# EasyEDA Pro project stm32rct6开发板.epro, schematic Schematic1

## Sheets
1 主控: Assembly Variant: Basic; Board Name: Board1; Create Date: 2026-08-18; Page Name: P1; Project Name: New Project_2026-08-18_10-06-32; Schematic Name: Schematic1; Update Date: 2026-08-18; Company: 嘉立创EDA; Page Size: A4; Version: V1.0
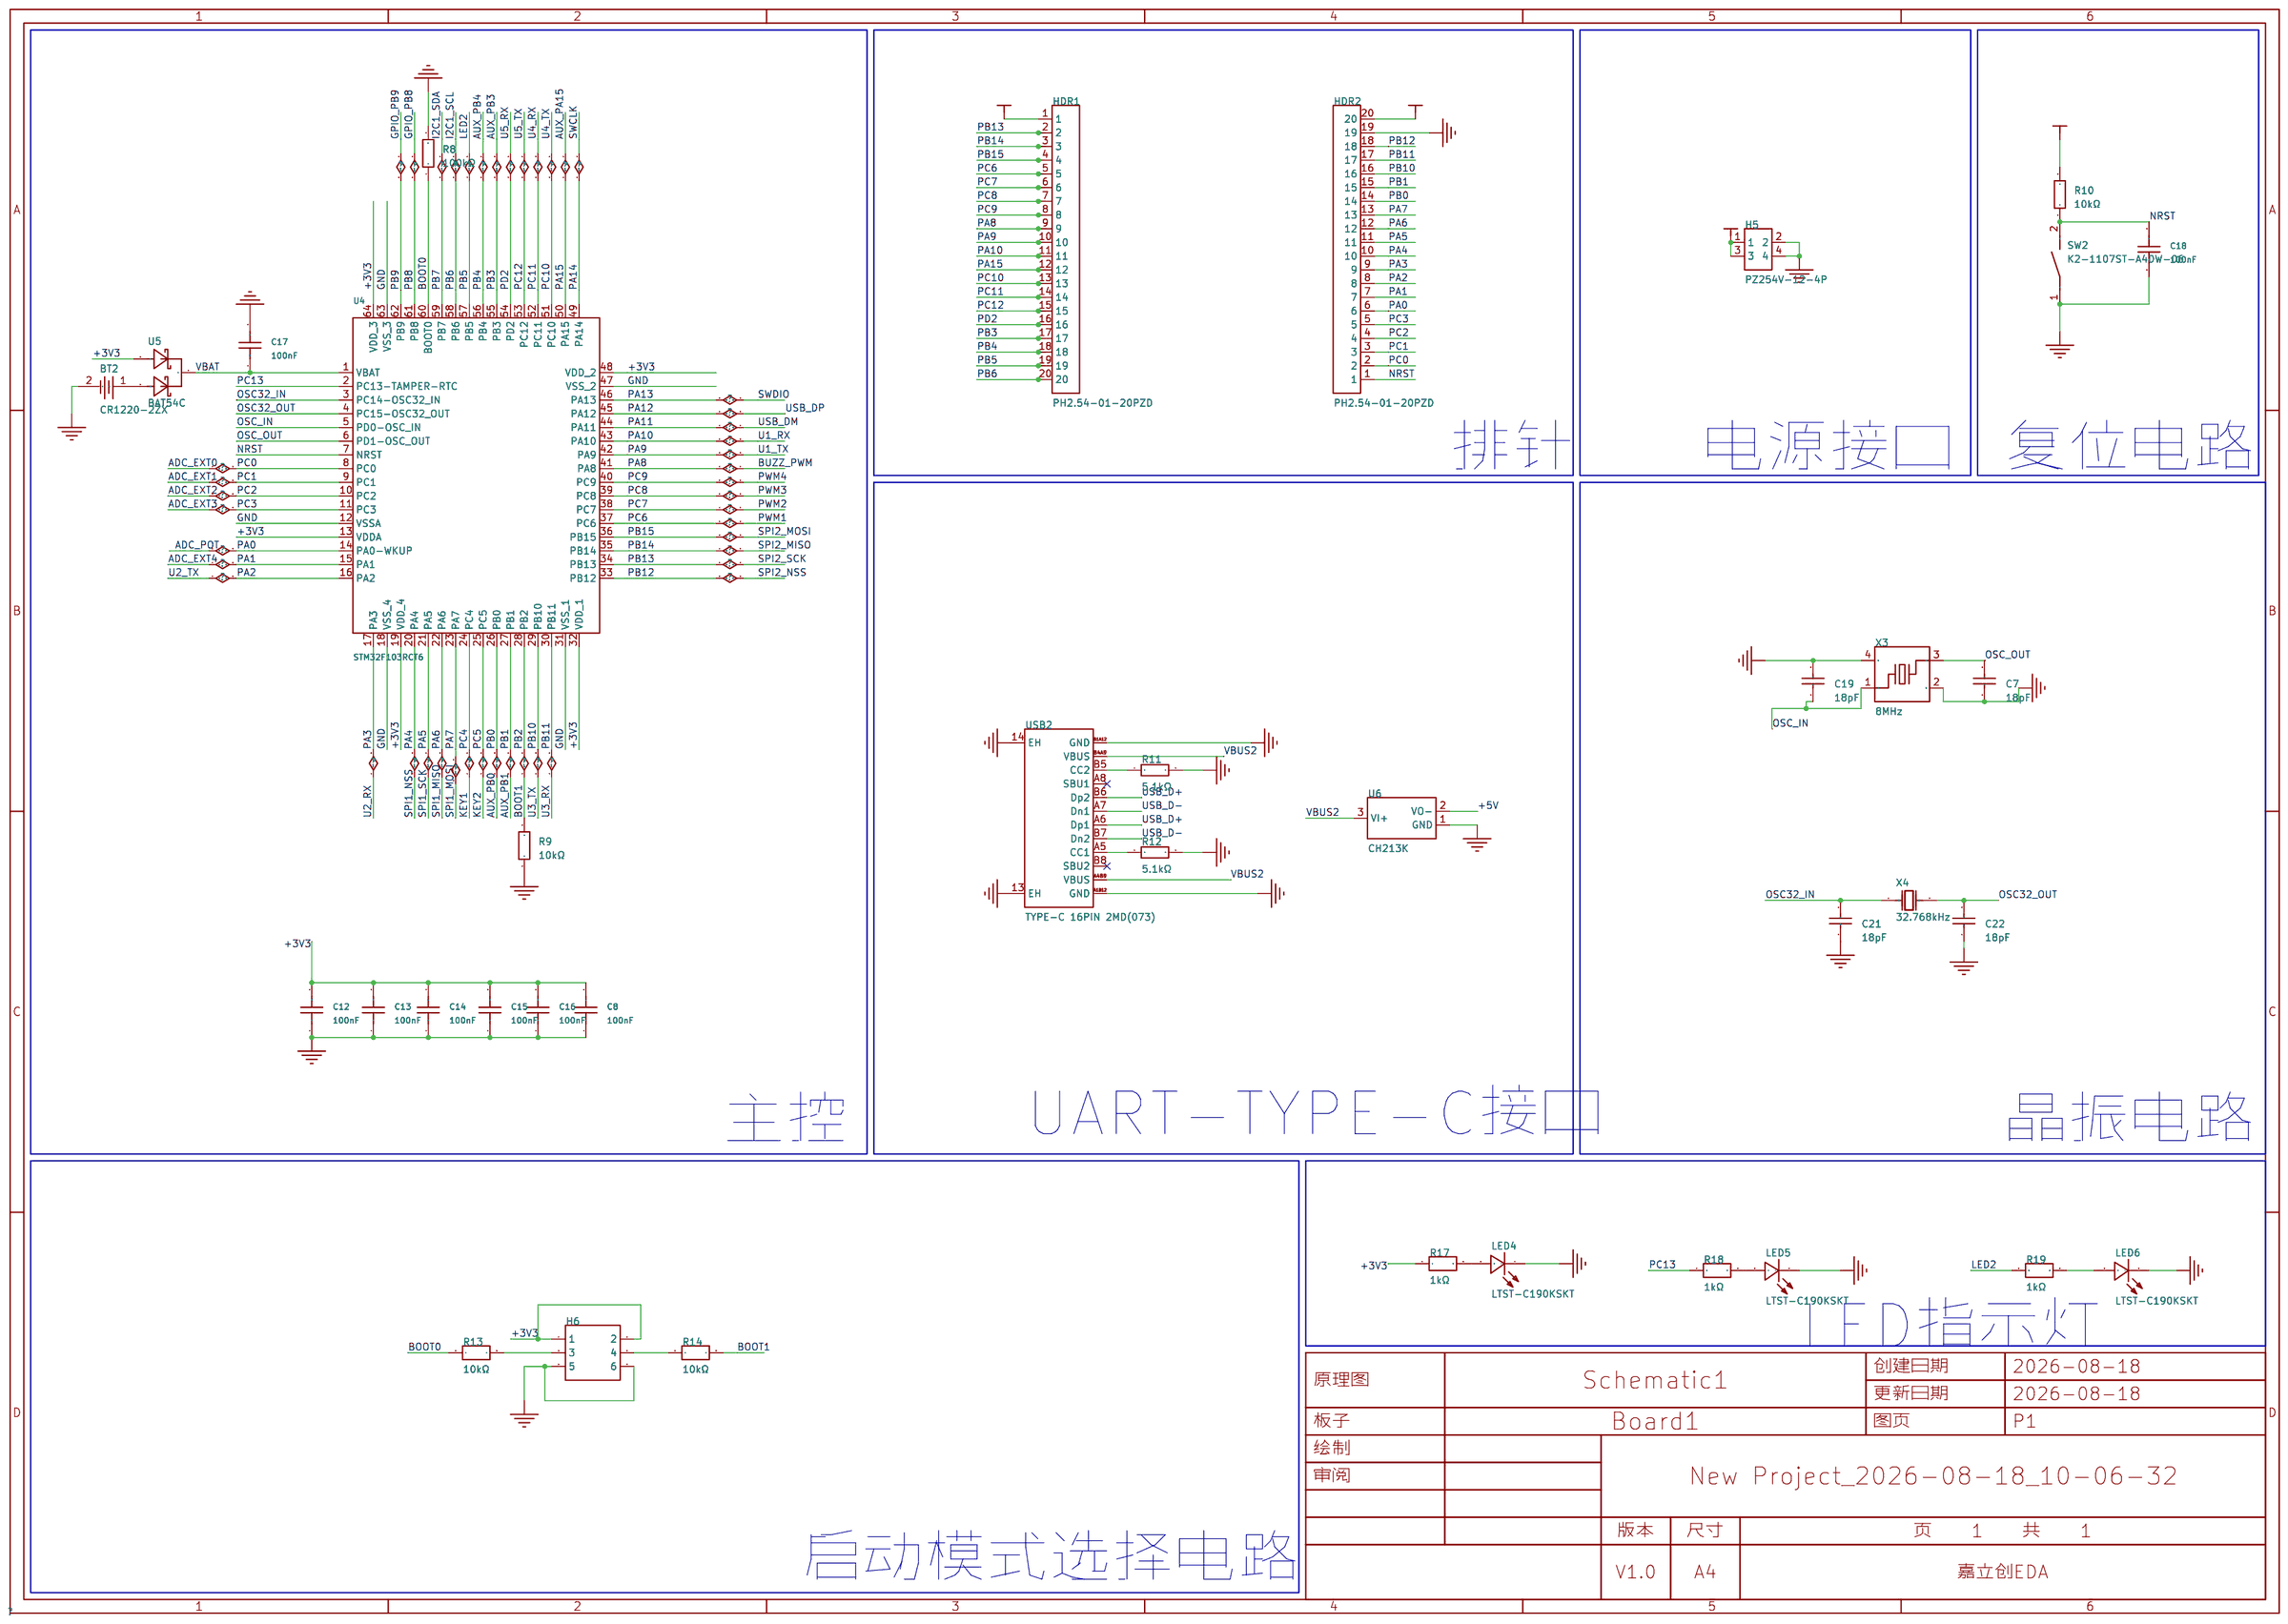
[diagram p0: 主控]
2 电源: Create Date: 2026-09-19; Project Name: 教学; Update Date: 2026-09-19
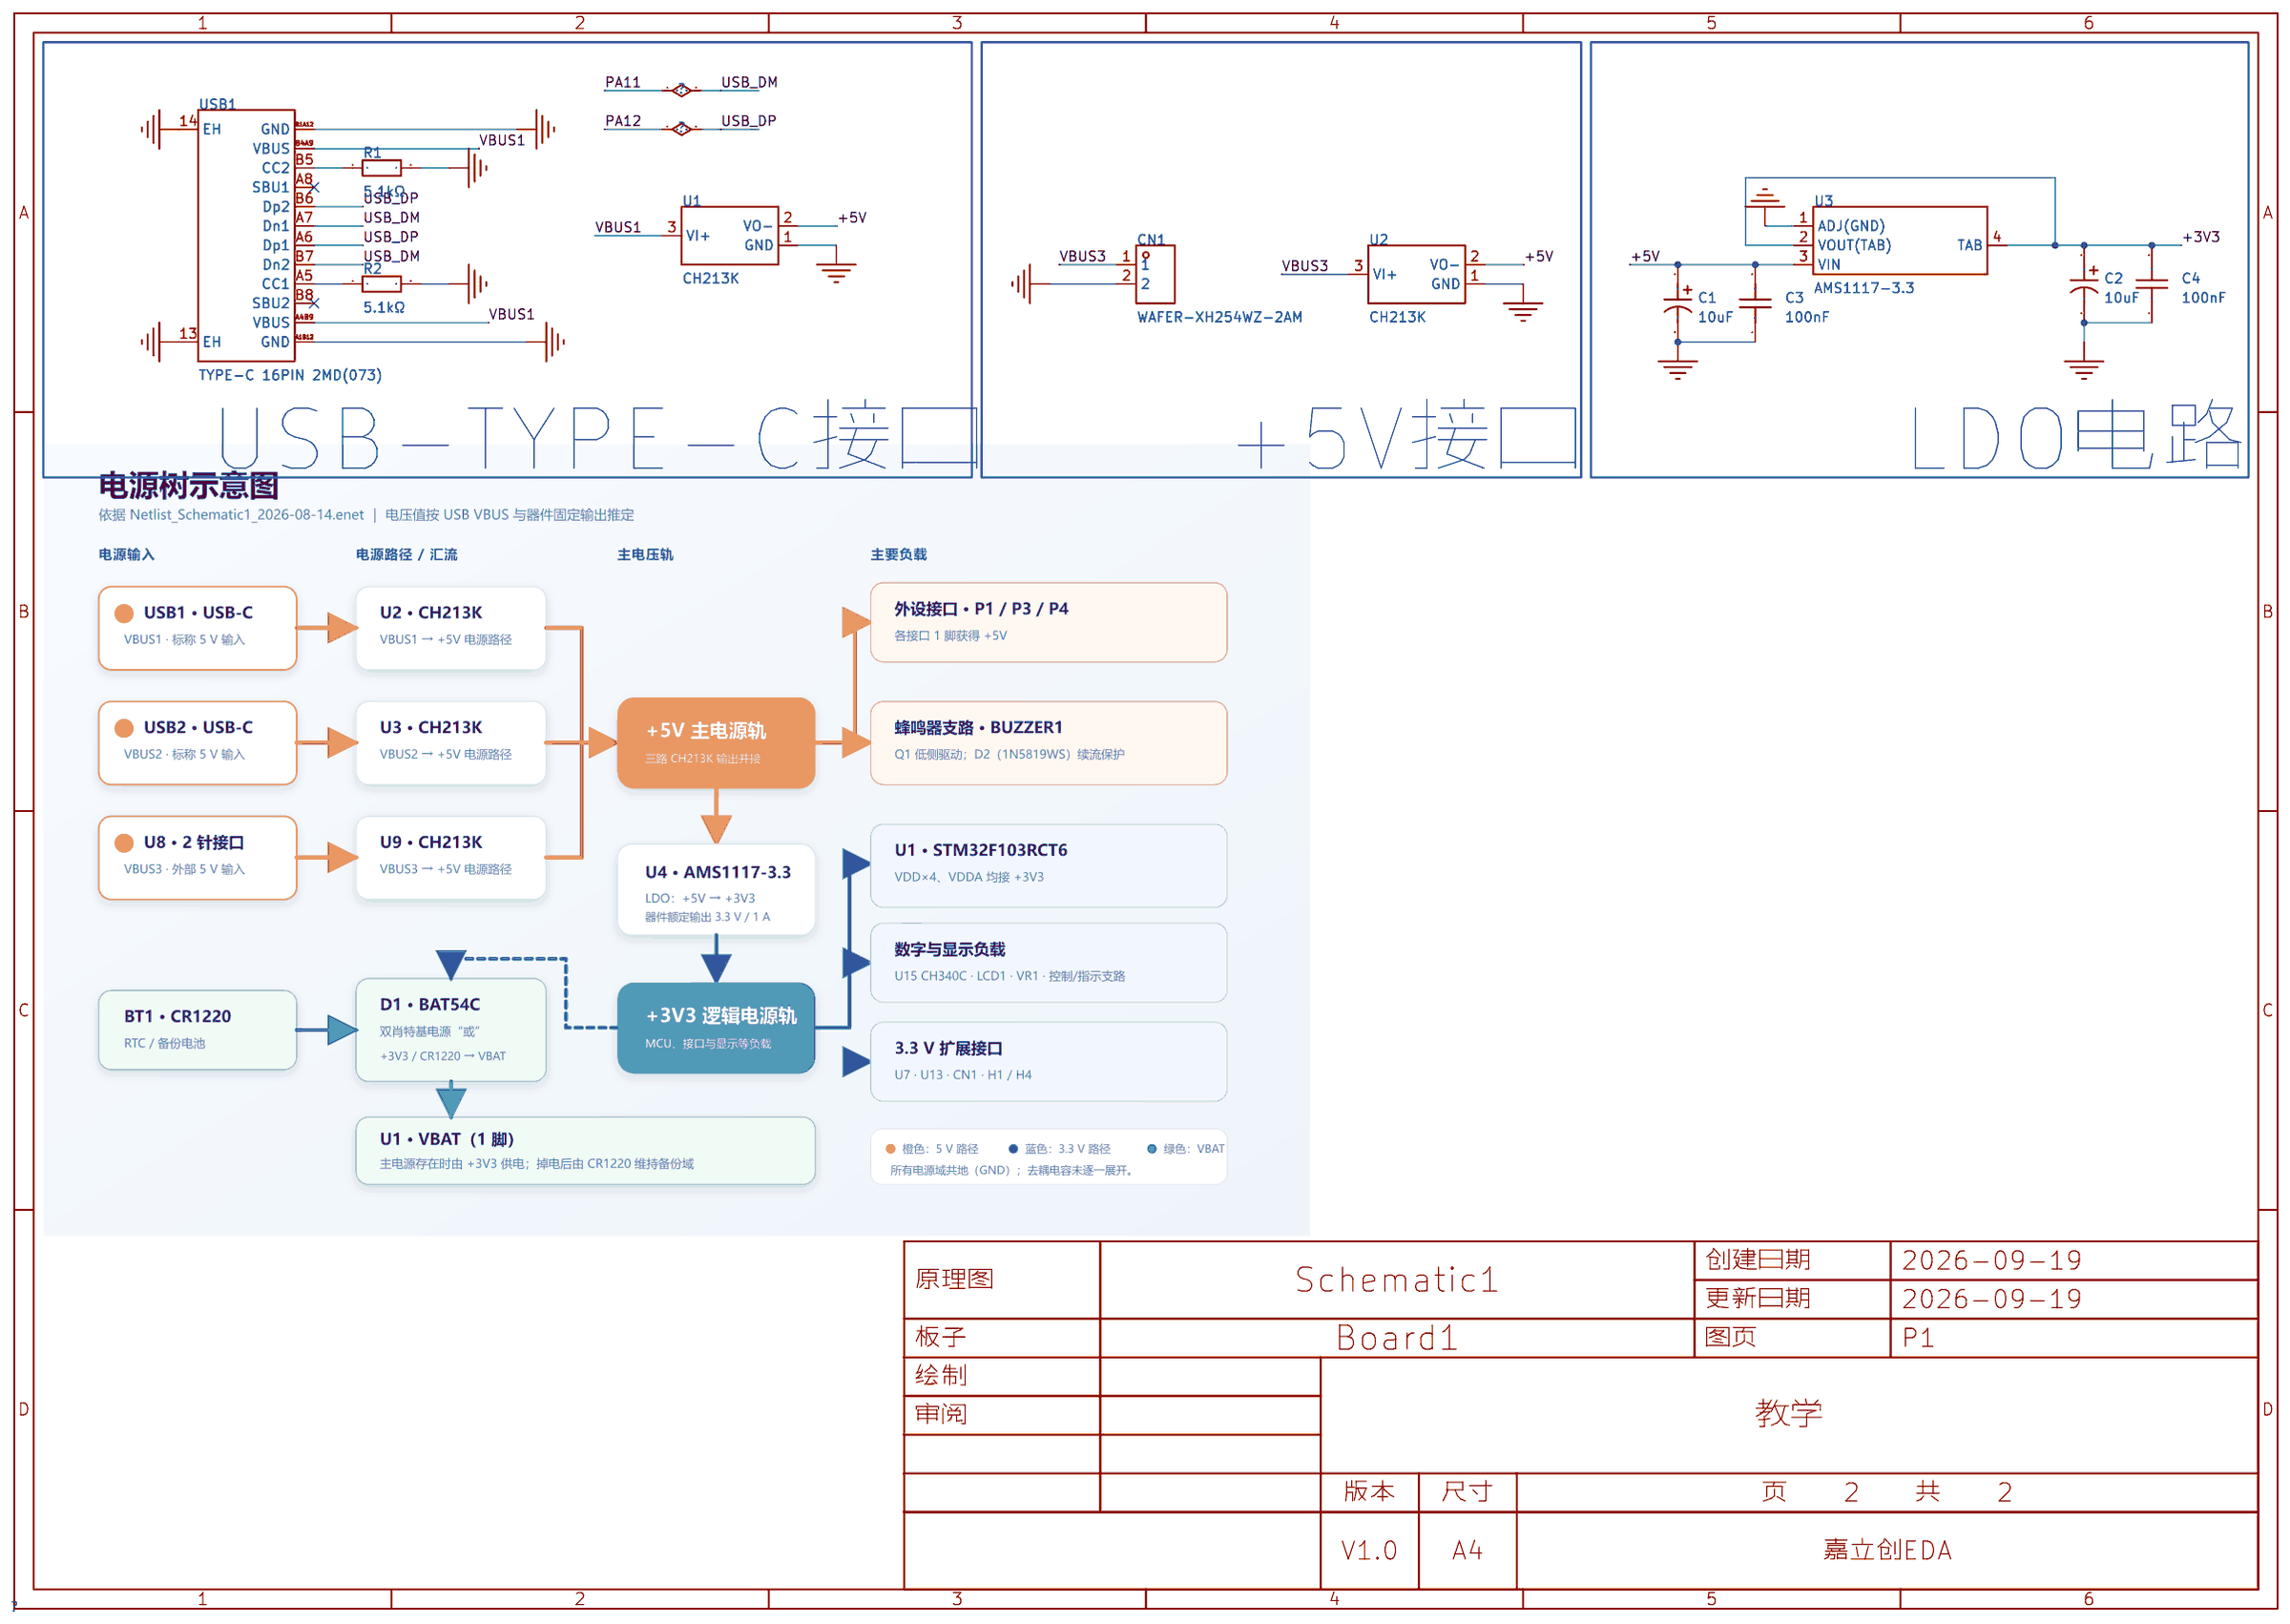
[diagram p1: 电源]
3 接口: Create Date: 2026-09-26; Project Name: 教学; Update Date: 2026-09-26
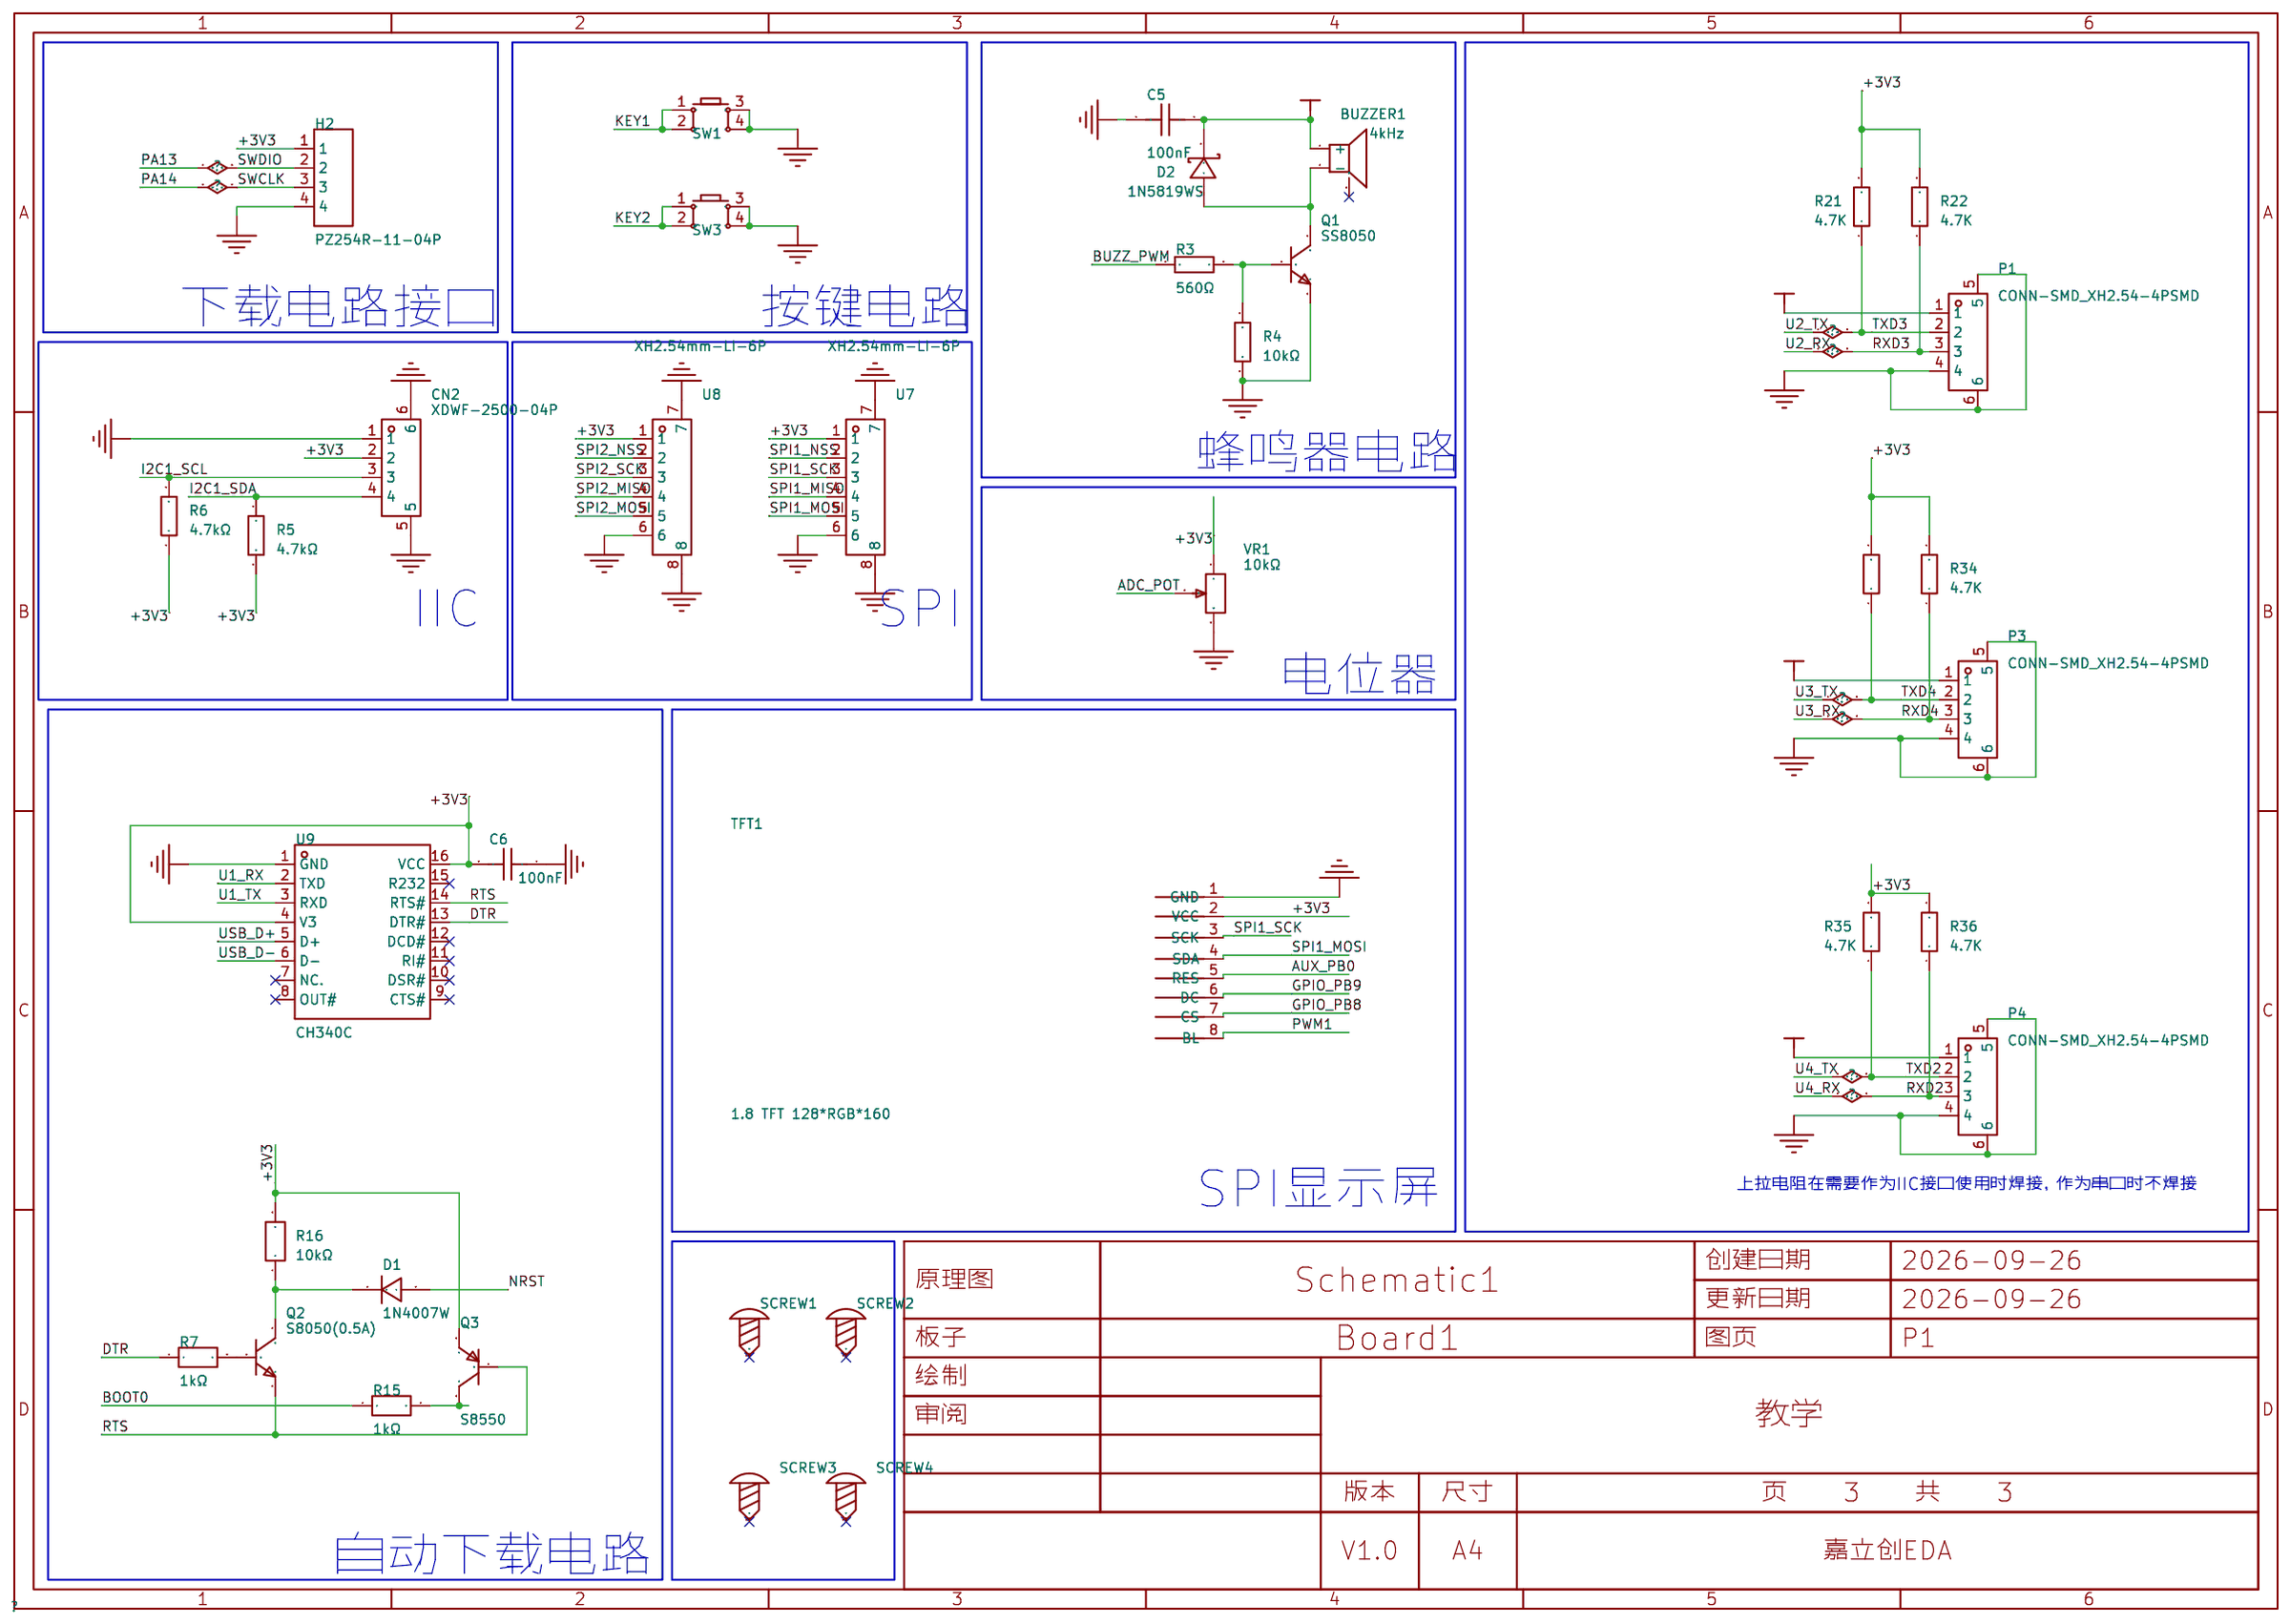
[diagram p2: 接口]

## Parts
sheet 主控
BT2  CR1220-2ZX  [BAT-SMD_CR1220-2ZX]
C7  18pF  [C0603]
C8  100nF  [C0603]
C12  100nF  [C0603]
C13  100nF  [C0603]
C14  100nF  [C0603]
C15  100nF  [C0603]
C16  100nF  [C0603]
C17  100nF  [C0603]
C18  100nF  [C0603]
C19  18pF  [C0603]
C21  18pF  [C0603]
C22  18pF  [C0603]
H5  PZ254V-12-4P  [HDR-TH_4P-P2.54-V-M-R2-C2-S2.54]
H6  -  [HDR-TH_6P-P2.54-V-R2-C3-S2.54_A2541WV-2X3P]
HDR1  PH2.54-01-20PZD  [HDR-TH_20P-P2.54-V-M-4]
HDR2  PH2.54-01-20PZD  [HDR-TH_20P-P2.54-V-M-4]
LED4  LTST-C190KSKT  [LED0603-RD]
LED5  LTST-C190KSKT  [LED0603-RD]
LED6  LTST-C190KSKT  [LED0603-RD]
R8  100kΩ  [R0603]
R9  10kΩ  [R0603]
R10  10kΩ  [R0603]
R11  5.1kΩ  [R0603]
R12  5.1kΩ  [R0603]
R13  10kΩ  [R0603]
R14  10kΩ  [R0603]
R17  1kΩ  [R0603]
R18  1kΩ  [R0603]
R19  1kΩ  [R0603]
SW2  K2-1107ST-A4DW-06  [KEY-SMD_L6.2-W3.6-LS8.0_K2-1107ST-A4SW-06]
U4  STM32F103RCT6  [LQFP-64_L10.0-W10.0-P0.50-LS12.0-BL]
U5  BAT54C  [SOT-23-3_L2.9-W1.3-P1.90-LS2.8-BR]
U6  CH213K  [SOT-23-3_L2.9-W1.6-P1.90-LS2.8-BR]
USB2  TYPE-C 16PIN 2MD(073)  [USB-C-SMD_TYPE-C-16PIN-2MD-073]
X3  8MHz  [CRYSTAL-SMD_4P-L3.2-W2.5-BL]
X4  32.768kHz  [CRYSTAL-SMD_L3.2-W1.5-1]
sheet 接口
BUZZER1  4kHz  [BUZ-SMD_L5.0-W5.5-P4.60]
C5  100nF  [C0603]
C6  100nF  [C0603]
CN2  XDWF-2500-04P  [CONN-SMD_4P-P2.54_MXXH-2.54-04P-WT1-0-A]
D1  1N4007W  [SOD-123FL_L2.7-W1.8-LS3.8-RD]
D2  1N5819WS  [SOD-323_L1.8-W1.3-LS2.5-RD]
H2  PZ254R-11-04P  [HDR-TH_4P-P2.54-H-M-W10.4]
P1  CONN-SMD_XH2.54-4PSMD  [CONN-SMD_XH2.54-4PSMD]
P3  CONN-SMD_XH2.54-4PSMD  [CONN-SMD_XH2.54-4PSMD]
P4  CONN-SMD_XH2.54-4PSMD  [CONN-SMD_XH2.54-4PSMD]
Q1  SS8050  [SOT-23_L2.9-W1.3-P1.90-LS2.4-BR]
Q2  S8050(0.5A)  [SOT-23-3_L2.9-W1.3-P1.90-LS2.4-BR]
Q3  S8550  [SOT-23-3_L2.9-W1.3-P1.90-LS2.4-BR]
R3  560Ω  [R0603]
R4  10kΩ  [R0603]
R5  4.7kΩ  [R0603]
R6  4.7kΩ  [R0603]
R7  1kΩ  [R0603]
R15  1kΩ  [R0603]
R16  10kΩ  [R0402]
R21  10K  [R0603]
R22  10K  [R0603]
R33  10K  [R0603]
R34  10K  [R0603]
R35  10K  [R0603]
R36  10K  [R0603]
SCREW1  -  [M3螺丝]
SCREW2  -  [M3螺丝]
SCREW3  -  [M3螺丝]
SCREW4  -  [M3螺丝]
SW1  -  [SW-SMD_4P-L6.0-W6.0-P4.50-LS9.0-2]
SW3  -  [SW-SMD_4P-L6.0-W6.0-P4.50-LS9.0-2]
TFT1  1.8 TFT 128*RGB*160  [LCD-TH_8P-P2.54-L56.0-W34.0_1.8-TFT]
U7  XH2.54mm-LI-6P  [CONN-SMD_6P-P2.50-H]
U8  XH2.54mm-LI-6P  [CONN-SMD_6P-P2.50-H]
U9  CH340C  [SOP-16_L10.0-W3.9-P1.27-LS6.0-BL]
VR1  10kΩ  [RES-ADJ-TH_3362P]
sheet 电源
C1  10uF  [CAP-SMD_BD5.0-L5.3-W5.3-LS6.0-FD]
C2  10uF  [CAP-SMD_BD5.0-L5.3-W5.3-LS6.0-FD]
C3  100nF  [C0603]
C4  100nF  [C0603]
CN1  WAFER-XH254WZ-2AM  [CONN-TH_2P-P2.50_WAFER-XH254WZ-2A]
R1  5.1kΩ  [R0603]
R2  5.1kΩ  [R0603]
U1  CH213K  [SOT-23-3_L2.9-W1.6-P1.90-LS2.8-BR]
U2  CH213K  [SOT-23-3_L2.9-W1.6-P1.90-LS2.8-BR]
U3  AMS1117-3.3  [SOT-223-4_L6.5-W3.5-P2.30-LS7.0-BR]
USB1  TYPE-C 16PIN 2MD(073)  [USB-C-SMD_TYPE-C-16PIN-2MD-073]

## Library data of the parts
BT2 = CR1220-2ZX: 连接器类型:电池底座;适用电池规格:CR1220;工作温度范围:-25℃~+85℃;; Supplier Part: C969906; Manufacturer: Q&J; Supplier Footprint: SMD; JLCPCB Part Class: 扩展库; Datasheet: https://atta.szlcsc.com/upload/public/pdf/source/20210107/C969906_C1D85B5C66CBBA4D1AEB8467FE1CEC7A.pdf; Supplier: LCSC; Connector Type: 电池底座; Battery Type: CR1220; Operating Temperature Range: -25℃~+85℃
C7 C19 C21 C22 = CC0603JRNPO9BN180: 容值:18pF;精度:±5%;额定电压:50V;温度系数:NP0;; LCSC Part Name: 18pF ±5% 50V; Supplier Part: C107040; Manufacturer: YAGEO(国巨); Supplier Footprint: 0603; JLCPCB Part Class: Extended Part; Datasheet: https://item.szlcsc.com/datasheet/CC0603JRNPO9BN180/108256.html; Supplier: LCSC; Tolerance: ±5%; Voltage Rating: 50V; Temperature Coefficient: NP0
C8 C12-C18 = CC0603KRX7R9BB104: 容值:100nF;精度:±10%;额定电压:50V;温度系数:X7R;; LCSC Part Name: 100nF ±10% 50V; Supplier Part: C14663; Manufacturer: YAGEO(国巨); Supplier Footprint: 0603; JLCPCB Part Class: Basic Part; Datasheet: https://item.szlcsc.com/datasheet/CC0603KRX7R9BB104/15331.html; Supplier: LCSC; Tolerance: ±10%; Voltage Rating: 50V; Temperature Coefficient: X7R
H5 = PZ254V-12-4P: 插针结构:2x2P;间距:2.54mm;行距:2.54mm;圆针/方针:方针;安装方式:直插;排数:双排;总PIN位数:4P;额定电流:-;额定电压:-;配合针长度:6mm;塑高:2.5mm;端接针长度:3mm;触头材质:黄铜;触头镀层:-;工作温度:-40℃~+105℃;颜色:黑色;; LCSC Part Name: 2x2P 间距:2.54mm 方针 直插; Supplier Part: C492419; Manufacturer: XFCN(兴飞); Supplier Footprint: 插件,P=2.54mm; JLCPCB Part Class: Extended Part; Datasheet: https://item.szlcsc.com/datasheet/PZ254V-12-4P/502975.html; Supplier: LCSC; Pin Structure: 2x2P; Pitch: 2.54mm; Row Spacing: 2.54mm; Circluar Pins/Square Pins: 方针; Mounting Type: 直插; Number of Rows: 双排; Number of Pins: 4P; Length of Mating Pin: 6mm; Insulation Height: 2.5mm; Length of End Connection Pin: 3mm; Contact Material: 黄铜; Operating Temperature: -40℃~+105℃; Color: 黑色
H6 = HDR-M_2.54_2x3: Supplier Part: C402781; Supplier Footprint: 插件,P=2.54mm; JLCPCB Part Class: 扩展库
HDR1 HDR2 = PH2.54-01-20PZD: 插针结构:1x20P;间距:2.54mm;圆针/方针:方针;安装方式:直插;排数:单排;总PIN位数:20P;额定电流:3A;配合针长度:6mm;塑高:2.5mm;端接针长度:3mm;触头材质:黄铜;触头镀层:金;工作温度:-40℃~+105℃;颜色:黑色;; LCSC Part Name: 1x20P 间距:2.54mm 方针 直插; Supplier Part: C7501591; Manufacturer: XUNPU(讯普); Supplier Footprint: 插件,P=2.54mm; JLCPCB Part Class: Extended Part; Datasheet: https://item.szlcsc.com/datasheet/PH2.54-01-20PZD/8584145.html; Supplier: LCSC; Pin Structure: 1x20P; Pitch: 2.54mm; Circluar Pins/Square Pins: 方针; Mounting Type: 直插; Number of Rows: 单排; Number of Pins: 20P; Current Rating: 3A; Length of Mating Pin: 6mm; Insulation Height: 2.5mm; Length of End Connection Pin: 3mm; Contact Material: 黄铜; Contact Plating: 金; Operating Temperature: -40℃~+105℃; Color: 黑色
LED4-LED6 = LTST-C190KSKT: 灯头类型:-;发光颜色:黄色;正向压降(Vf):2.1V;功率:75mW;正向电流:20mA;波长:584.5nm~597nm;二极管配置:独立二极管;透镜颜色:无色透明透镜;色温:-;发光强度:104mcd;发光角度:130°;载带方式:-;工作温度:-30℃~+85℃;; LCSC Part Name: 黄灯; Supplier Part: C125095; Manufacturer: LITEON(光宝); Supplier Footprint: 0603; JLCPCB Part Class: Extended Part; Datasheet: https://item.szlcsc.com/datasheet/LTST-C190KSKT/136371.html; Supplier: LCSC; Illumination Color: 黄色; Voltage - Forward(Vf): 2.1V; Power(Watts): 75mW; Forward Current: 20mA; Wavelength - Dominant: 584.5nm~597nm; Peak Wavelength: 588nm; Diode Configuration: 独立二极管; Lens Color: 无色透明透镜; Luminous Intensity: 104mcd; Viewing Angle: 130°; Operating Temperature: -30℃~+85℃
R8 = 0603WAF1003T5E: 电阻类型:厚膜电阻;阻值:100kΩ;精度:±1%;功率:100mW;工作电压:75V;温度系数:±100ppm/℃;; LCSC Part Name: 100kΩ ±1% 100mW 厚膜电阻; Supplier Part: C25803; Manufacturer: UNI-ROYAL(厚声); Supplier Footprint: 0603; JLCPCB Part Class: Basic Part; Datasheet: https://item.szlcsc.com/datasheet/0603WAF1003T5E/26546.html; Supplier: LCSC; Type: 厚膜电阻; Tolerance: ±1%; Power(Watts): 100mW; Voltage-Supply(Max): 75V; Temperature Coefficient: ±100ppm/℃; Operating Temperature: -55℃~+155℃
R4 R9 R10 = 0603WAF1002T5E: 电阻类型:厚膜电阻;阻值:10kΩ;精度:±1%;功率:100mW;工作电压:75V;温度系数:±100ppm/℃;; LCSC Part Name: 厚膜电阻 10kΩ ±1% 100mW; Supplier Part: C25804; Manufacturer: UNI-ROYAL(厚声); Supplier Footprint: 0603; JLCPCB Part Class: Basic Part; Datasheet: https://item.szlcsc.com/datasheet/0603WAF1002T5E/26547.html; Supplier: LCSC; Type: 厚膜电阻; Tolerance: ±1%; Power(Watts): 100mW; Voltage-Supply(Max): 75V; Temperature Coefficient: ±100ppm/℃; Operating Temperature: -55℃~+155℃
R1 R2 R11 R12 = 0603WAF5101T5E: 电阻类型:厚膜电阻;阻值:5.1kΩ;精度:±1%;功率:100mW;工作电压:75V;温度系数:±100ppm/℃;; LCSC Part Name: 5.1kΩ ±1% 100mW 厚膜电阻; Supplier Part: C23186; Manufacturer: UNI-ROYAL(厚声); Supplier Footprint: 0603; JLCPCB Part Class: Basic Part; Datasheet: https://item.szlcsc.com/datasheet/0603WAF5101T5E/23913.html; Supplier: LCSC; Type: 厚膜电阻; Tolerance: ±1%; Power(Watts): 100mW; Voltage-Supply(Max): 75V; Temperature Coefficient: ±100ppm/℃; Operating Temperature: -55℃~+155℃
R13 R14 = FRC0603J103 TS: 电阻类型:厚膜电阻;阻值:10kΩ;精度:±5%;功率:100mW;工作电压:75V;温度系数:±100ppm/℃;; LCSC Part Name: 10kΩ ±5% 100mW 厚膜电阻; Supplier Part: C2930027; Manufacturer: FOJAN(富捷); Supplier Footprint: 0603; JLCPCB Part Class: Extended Part; Datasheet: https://item.szlcsc.com/datasheet/FRC0603J103%2520TS/3266960.html; Supplier: LCSC; Type: 厚膜电阻; Tolerance: ±5%; Power(Watts): 100mW; Voltage-Supply(Max): 75V; Temperature Coefficient: ±100ppm/℃; Operating Temperature: -55℃~+155℃
R7 R15 R17-R19 = FRC0603F1001TS: 电阻类型:厚膜电阻;阻值:1kΩ;精度:±1%;功率:100mW;工作电压:75V;温度系数:±100ppm/℃;; LCSC Part Name: 1kΩ ±1% 100mW 厚膜电阻; Supplier Part: C2907002; Manufacturer: FOJAN(富捷); Supplier Footprint: 0603; JLCPCB Part Class: Extended Part; Datasheet: https://item.szlcsc.com/datasheet/FRC0603F1001TS/3180515.html; Supplier: LCSC; Type: 厚膜电阻; Tolerance: ±1%; Power(Watts): 100mW; Voltage-Supply(Max): 75V; Temperature Coefficient: ±100ppm/℃; Operating Temperature: -55℃~+155℃
SW2 = K2-1107ST-A4DW-06: 电路结构:单刀单掷;按钮形状:矩形按钮;作用力:2.5N;安装方式:立贴;开关长度:6.1mm;开关宽度:3.6mm;开关高度:2.5mm;触点电流:50mA;额定电压:12V;带灯:-;工作寿命:10万次;; LCSC Part Name: 轻触开关 3.6*6.1*2.5; Supplier Part: C118141; Manufacturer: 韩国韩荣; Supplier Footprint: SMD,6.1x3.6mm; JLCPCB Part Class: Extended Part; Datasheet: https://item.szlcsc.com/datasheet/K2-1107ST-A4DW-06/119400.html; Supplier: LCSC; Circuit: 单刀单掷; Actuator Style: 矩形按钮; Operating Force: 2.5N; Mounting Type: 立贴; Length: 6.1mm; Width: 3.6mm; Switch Height: 2.5mm; Contact Current: 50mA; Voltage Rating: 12V; Life: 10万次; Operating Temperature: -25℃~+85℃
U4 = STM32F103RCT6: CPU内核:ARM Cortex-M3;CPU最大主频:72MHz;CPU位数:32 Bit;; LCSC Part Name: 主流增强型ARM Cortex-M3 MCU，具有256 KB Flash、72 MHz CPU、电机控制、USB和CAN; Supplier Part: C8323; Manufacturer: ST(意法半导体); Supplier Footprint: LQFP-64(10x10); JLCPCB Part Class: Extended Part; Datasheet: https://item.szlcsc.com/datasheet/STM32F103RCT6/8815.html; Supplier: LCSC; CPU Core: ARM Cortex-M3; CPU Maximum Speed: 72MHz; Core Size: 32 Bit; Program Storage Size: 256KB; Program Memory Type: FLASH; RAM Size: 48KB; Number of I/O: 51; ADC (Bit): 12bit; DAC (Bit): 12bit; Oscillator Type: 内置; Voltage - Supply: 2V~3.6V; Operating Temperature: -40℃~+85℃
U5 = BAT54C_C22466350: 二极管配置:1对共阴极;正向压降(Vf):1V@100mA;直流反向耐压(Vr):30V;整流电流:200mA;; LCSC Part Name: 电压:30V 电流:0.2A; Supplier Part: C22466350; Manufacturer: R+O(宏嘉诚); Supplier Footprint: SOT-23; JLCPCB Part Class: Extended Part; Datasheet: https://item.szlcsc.com/datasheet/BAT54C/24165509.html; Supplier: LCSC; Diode Configuration: 1对共阴极; Voltage - Forward(Vf@If): 1V@100mA; Voltage - DC Reverse(Vr): 30V; Current - Rectified: 200mA; Reverse Leakage Current (Ir): 2uA@25V; Non-Repetitive Peak Forward Surge Current: 600mA
U1 U2 U6 = CH213K: Supplier Part: C5456874; Manufacturer: WCH(南京沁恒); Supplier Footprint: SOT-23-3; JLCPCB Part Class: Extended Part; Datasheet: https://item.szlcsc.com/datasheet/CH213K/6369803.html; Supplier: LCSC
USB1 USB2 = TYPE-C 16PIN 2MD(073): 连接器类型:Type-C;协议标准:-;公母:母;安装方式:卧贴;触点数量:16P;端口数量:1;额定电流 - 电源:3A;工作温度:-25℃~+85℃;; LCSC Part Name: Type-C 母 卧贴; Supplier Part: C2765186; Manufacturer: SHOU HAN(首韩); Supplier Footprint: SMD; JLCPCB Part Class: Extended Part; Datasheet: https://item.szlcsc.com/datasheet/TYPE-C%252016PIN%25202MD(073)/2901843.html; Supplier: LCSC; Connector Type: Type-C; Gender: 母; Mounting Type: 卧贴; Number of Contacts: 16P; Number of Ports: 1; Current Rating-Power: 3A; Voltage Rating: 5V; Connect-Disconnect Life: 1万次; Detection color: 黑色; Operating Temperature: -25℃~+85℃
X3 = X32258MOB4SI: 晶振类型:贴片晶振;频率:8MHz;常温频差:±10ppm;负载电容:12pF;频率稳定度:±20ppm;; LCSC Part Name: YSX321SL 8MHZ 4P 3225 12PF ±10PPM -40~85℃ (±20PPM); Supplier Part: C2682775; Manufacturer: YXC(扬兴晶振); Supplier Footprint: SMD3225-4P; JLCPCB Part Class: Extended Part; Datasheet: https://item.szlcsc.com/datasheet/X32258MOB4SI/2777872.html; Supplier: LCSC; Type: 贴片晶振; Normal temperature Frequency Tolerance: ±10ppm; Load Capacitance: 12pF; Frequency Stability: ±20ppm; Equivalent Series Resistance(ESR): 150Ω; Operating Temperature: -40℃~+85℃
X4 = XKXGI-SUA-32.768K: 晶振类型:贴片晶振;频率:32.768kHz;常温频差:±20ppm;负载电容:12.5pF;频率稳定度:±30ppm;; LCSC Part Name: YST310S 32.768KHZ 2P 3215 12.5PF ±20PPM -40~85℃; Supplier Part: C5213671; Manufacturer: YXC(扬兴晶振); Supplier Footprint: SMD3215-2P; JLCPCB Part Class: Extended Part; Datasheet: https://item.szlcsc.com/datasheet/XKXGI-SUA-32.768K/5908943.html; Supplier: LCSC; Type: 贴片晶振; Normal temperature Frequency Tolerance: ±20ppm; Load Capacitance: 12.5pF; Frequency Stability: ±30ppm; Equivalent Series Resistance(ESR): 70kΩ; Operating Temperature: -40℃~+85℃
BUZZER1 = MLT-5020: 驱动方式:无源(外部驱动);构造类型:电磁式;额定电压:3V;频率:4kHz;声压(SPL):75dB;; LCSC Part Name: 无源(外部驱动) 电磁式 4kHz; Supplier Part: C94598; Manufacturer: 华能; Supplier Footprint: SMD,5x5mm; JLCPCB Part Class: Extended Part; Datasheet: https://item.szlcsc.com/datasheet/MLT-5020/95796.html; Supplier: LCSC; Driver Circuitry: 无源(外部驱动); Technology: 电磁式; Voltage Rating: 3V; Voltage - Supply: 2V~4V; Current Consumption: 100mA; Sound Pressure Level(SPL): 75dB; Length: 5.2mm; Width: 5.2mm; Height: 2.5mm; Operating Temperature: -20℃~+70℃
C5 = CL10B104KB8NNNC: 容值:100nF;精度:±10%;额定电压:50V;温度系数:X7R;; LCSC Part Name: 100nF ±10% 50V; Supplier Part: C1591; Manufacturer: SAMSUNG(三星); Supplier Footprint: 0603; JLCPCB Part Class: Extended Part; Datasheet: https://item.szlcsc.com/datasheet/CL10B104KB8NNNC/1943.html; Supplier: LCSC; Tolerance: ±10%; Voltage Rating: 50V; Temperature Coefficient: X7R
C3 C4 C6 = FCC0603B104K500CT: 容值:100nF;精度:±10%;额定电压:50V;温度系数:X7R;; LCSC Part Name: 100nF ±10% 50V; Supplier Part: C5137636; Manufacturer: FOJAN(富捷); Supplier Footprint: 0603; JLCPCB Part Class: Extended Part; Datasheet: https://item.szlcsc.com/datasheet/FCC0603B104K500CT/5747088.html; Supplier: LCSC; Tolerance: ±10%; Voltage Rating: 50V; Temperature Coefficient: X7R
CN2 = XDWF-2500-04P: 插针结构:1x4P;间距:2.54mm;安装方式:卧贴;参考系列:XH;总PIN数:4P;排数:1;每排PIN数:4;额定电流:4A;触头材质:黄铜;工作温度:-40℃~+85℃;; LCSC Part Name: 1x4P 间距:2.54mm 卧贴 系列:XH; Supplier Part: C19723931; Manufacturer: LX(连欣科技); Supplier Footprint: SMD,P=2.5mm,卧贴; JLCPCB Part Class: Extended Part; Datasheet: https://item.szlcsc.com/datasheet/XDWF-2500-04P/21042237.html; Supplier: LCSC; Pins Structure: 1x4P; Pitch: 2.54mm; Mounting Type: 卧贴; Reference Series: XH; Number of Pins: 4P; Number of Rows: 1; Number of PINs Per Row: 4; Current Rating: 4A; Contact Material: 黄铜; Operating Temperature: -40℃~+85℃; Voltage Rating: 250V; Plastic Material: LCP; Color: 米色; Z-Height of the Board: 6mm; Y-Width of Bottom Edge on Board: 11.6mm
D1 = 1N4007W_C18199088: 二极管配置:独立式;正向压降(Vf):1V@1A;直流反向耐压(Vr):1kV;整流电流:1A;; LCSC Part Name: 1kV 1A; Supplier Part: C18199088; Manufacturer: R+O(宏嘉诚); Supplier Footprint: SOD-123FL; JLCPCB Part Class: Extended Part; Datasheet: https://item.szlcsc.com/datasheet/1N4007W/19354320.html; Supplier: LCSC; Diode Configuration: 独立式; Voltage - Forward(Vf@If): 1V@1A; Voltage - DC Reverse(Vr): 1kV; Current - Rectified: 1A; Reverse Leakage Current (Ir): 2uA@1000V; Non-Repetitive Peak Forward Surge Current: 30A; Operating Junction Temperature Range: -55℃~+150℃
D2 = 1N5819WS_C191023: 正向压降(Vf):600mV@1A;直流反向耐压(Vr):40V;整流电流:1A;; LCSC Part Name: 电压:40V 电流:1A; Supplier Part: C191023; Manufacturer: Hottech(合科泰); Supplier Footprint: SOD-323; JLCPCB Part Class: Basic Part; Datasheet: https://item.szlcsc.com/datasheet/1N5819WS/213850.html; Supplier: LCSC; Voltage - Forward(Vf@If): 600mV@1A; Voltage - DC Reverse(Vr): 40V; Current - Rectified: 1A; Non-Repetitive Peak Forward Surge Current: 25A
H2 = PZ254R-11-04P: 插针结构:1x4P;间距:2.54mm;行距:-;圆针/方针:方针;安装方式:弯插;排数:单排;总PIN位数:4P;额定电流:3A;额定电压:250V;配合针长度:6mm;塑高:2.5mm;端接针长度:-;触头材质:黄铜;触头镀层:-;工作温度:-40℃~+105℃;颜色:黑色;; LCSC Part Name: 1x4P 间距:2.54mm 方针 弯插; Supplier Part: C492412; Manufacturer: XFCN(兴飞); Supplier Footprint: 弯插,P=2.54mm; JLCPCB Part Class: Extended Part; Datasheet: https://item.szlcsc.com/datasheet/PZ254R-11-04P/502968.html; Supplier: LCSC; Pin Structure: 1x4P; Pitch: 2.54mm; Circluar Pins/Square Pins: 方针; Mounting Type: 弯插; Number of Rows: 单排; Number of Pins: 4P; Current Rating: 3A; Voltage Rating (Max): 250V; Length of Mating Pin: 6mm; Insulation Height: 2.5mm; Contact Material: 黄铜; Operating Temperature: -40℃~+105℃; Color: 黑色
P1 P3 P4 = CONN-SMD_XH2.54-4PSMD: Supplier Part: C9900018341; Supplier Footprint: CONN-SMD-4P; JLCPCB Part Class: 扩展库; Supplier: LCSC
Q1 = SS8050_C431710: 晶体管类型:NPN;集电极电流(Ic):1.5A;集射极击穿电压(Vceo):25V;耗散功率(Pd):300mW;直流电流增益(hFE):400@100mA,1V;; LCSC Part Name: (200-350) NPN 电流:1.5A 电压:25V; Supplier Part: C431710; Manufacturer: MDD(辰达半导体); Supplier Footprint: SOT-23; JLCPCB Part Class: Extended Part; Datasheet: https://item.szlcsc.com/datasheet/SS8050/428175.html; Supplier: LCSC; type: NPN; Current - Collector(Ic): 1.5A; Collector - Emitter Voltage VCEO: 25V; Pd - Power Dissipation: 300mW; DC Current Gain: 400@100mA,1V; Transition frequency(fT): 100MHz; Current - Collector Cutoff: 100nA; Vce Saturation(VCE(sat)): 500mV@800mA,80mA; Operating Temperature: -55℃~+150℃; Emitter-Base Voltage(Vebo): 5V; Number: 1个NPN
Q2 = S8050(0.5A): 晶体管类型:NPN;集电极电流(Ic):500mA;集射极击穿电压(Vceo):25V;耗散功率(Pd):300mW;直流电流增益(hFE):120;; LCSC Part Name: 电流:0.5A 电压:25V; Supplier Part: C3014350; Manufacturer: EIC; Supplier Footprint: SOT-23; JLCPCB Part Class: Extended Part; Datasheet: https://item.szlcsc.com/datasheet/S8050(0.5A)/3524496.html; Supplier: LCSC; type: NPN; Current - Collector(Ic): 500mA; Collector - Emitter Voltage VCEO: 25V; Pd - Power Dissipation: 300mW; DC Current Gain: 120; Transition frequency(fT): 150MHz; Current - Collector Cutoff: 100nA; Vce Saturation(VCE(sat)): 600mV; Emitter-Base Voltage(Vebo): 5V; Number: 1个NPN
Q3 = S8550_C20069126: 晶体管类型:PNP;集电极电流(Ic):500mA;集射极击穿电压(Vceo):25V;耗散功率(Pd):300mW;直流电流增益(hFE):120;; LCSC Part Name: hFE:200-350，丝印:2TY PNP 电流:500mA 电压:25V; Supplier Part: C20069126; Manufacturer: R+O(宏嘉诚); Supplier Footprint: SOT-23; JLCPCB Part Class: Extended Part; Datasheet: https://item.szlcsc.com/datasheet/S8550/21397164.html; Supplier: LCSC; type: PNP; Current - Collector(Ic): 500mA; Collector - Emitter Voltage VCEO: 25V; Pd - Power Dissipation: 300mW; DC Current Gain: 120; Transition frequency(fT): 150MHz; Current - Collector Cutoff: 100nA; Vce Saturation(VCE(sat)): 500mV; Operating Temperature: -55℃~+150℃; Emitter-Base Voltage(Vebo): 5V; Number: 1个PNP
R3 = 0603WAF5600T5E: 电阻类型:厚膜电阻;阻值:560Ω;精度:±1%;功率:100mW;工作电压:75V;温度系数:±100ppm/℃;; LCSC Part Name: 560Ω ±1% 100mW 厚膜电阻; Supplier Part: C23204; Manufacturer: UNI-ROYAL(厚声); Supplier Footprint: 0603; JLCPCB Part Class: Basic Part; Datasheet: https://item.szlcsc.com/datasheet/0603WAF5600T5E/23931.html; Supplier: LCSC; Type: 厚膜电阻; Tolerance: ±1%; Power(Watts): 100mW; Voltage-Supply(Max): 75V; Temperature Coefficient: ±100ppm/℃; Operating Temperature: -55℃~+155℃
R5 R6 = 0603WAF4701T5E: 电阻类型:厚膜电阻;阻值:4.7kΩ;精度:±1%;功率:100mW;工作电压:75V;温度系数:±100ppm/℃;; LCSC Part Name: 4.7kΩ ±1% 100mW 厚膜电阻; Supplier Part: C23162; Manufacturer: UNI-ROYAL(厚声); Supplier Footprint: 0603; JLCPCB Part Class: Basic Part; Datasheet: https://item.szlcsc.com/datasheet/0603WAF4701T5E/23889.html; Supplier: LCSC; Type: 厚膜电阻; Tolerance: ±1%; Power(Watts): 100mW; Voltage-Supply(Max): 75V; Temperature Coefficient: ±100ppm/℃; Operating Temperature: -55℃~+155℃
R16 = FRC0402F1002TS: 电阻类型:厚膜电阻;阻值:10kΩ;精度:±1%;功率:62.5mW;工作电压:50V;温度系数:±100ppm/℃;; LCSC Part Name: 10kΩ ±1% 62.5mW 厚膜电阻; Supplier Part: C2906861; Manufacturer: FOJAN(富捷); Supplier Footprint: 0402; JLCPCB Part Class: Extended Part; Datasheet: https://item.szlcsc.com/datasheet/FRC0402F1002TS/3180374.html; Supplier: LCSC; Type: 厚膜电阻; Tolerance: ±1%; Power(Watts): 62.5mW; Voltage-Supply(Max): 50V; Temperature Coefficient: ±100ppm/℃; Operating Temperature: -55℃~+155℃
R21 R22 R33-R36 = Res_0603: Supplier Footprint: 0603
SCREW1-SCREW4 = M3螺丝: Supplier Footprint: 插件
SW1 SW3 = Key_SMD_6x6x6.5: Supplier Footprint: SMD
TFT1 = 1.8 TFT 128*RGB*160: Supplier Part: C9900080251; Supplier Footprint: 插件; Supplier: LCSC
U7 U8 = XH2.54mm-LI-6P: Supplier Part: C2842318; Supplier Footprint: SMD-6_7.8X17.5X2.5P; JLCPCB Part Class: 扩展库; Supplier: LCSC
U9 = CH340C: 应用功能:收发器;接口协议:USB 2.0;数据速率:2Mbps;; LCSC Part Name: CH340C USB转串口芯片 CH340; Supplier Part: C84681; Manufacturer: WCH(南京沁恒); Supplier Footprint: SOP-16; JLCPCB Part Class: 扩展库; Datasheet: https://atta.szlcsc.com/upload/public/pdf/source/20240619/63986D8440D4E5267A77ACD891CC4DE3.pdf; Supplier: LCSC; Applications Function: 收发器; Protocol: USB 2.0; Supply Voltage: 3.3V；5V; Data Rate: 2Mbps
VR1 = 3362P-1-103LF: 阻值:10kΩ;精度:±10%;功率:500mW;温度系数:±100ppm/℃;; LCSC Part Name: 10kΩ ±10%; Supplier Part: C58159; Manufacturer: BOURNS; Supplier Footprint: 插件-3P,7x6.6mm; JLCPCB Part Class: Extended Part; Datasheet: https://item.szlcsc.com/datasheet/3362P-1-103LF/59198.html; Supplier: LCSC; Tolerance: ±10%; Power(Watts): 500mW; Temperature Coefficient: ±100ppm/℃; Number of Turns: 1
C1 C2 = JVJ50v10M5x5: 容值:10uF;精度:±20%;额定电压:50V;纹波电流:18mA@120Hz;; LCSC Part Name: 10uF ±20% 50V; Supplier Part: C46550416; Manufacturer: JIERR(捷而瑞); Supplier Footprint: SMD,D5xL5.4mm; JLCPCB Part Class: Extended Part; Datasheet: https://item.szlcsc.com/datasheet/JVJ50v10M5x5/48680110.html; Supplier: LCSC; Tolerance: ±20%; Voltage Rating: 50V; Ripple Current: 18mA@120Hz; Diameter: 5mm; Height - Seated (Max): 5.4mm; Lifetime: 2000hrs@105℃; Operating Temperature: -55℃~+105℃
CN1 = WAFER-XH254WZ-2AM: 插针结构:1x2P;间距:2.54mm;安装方式:弯插;参考系列:XH;总PIN数:2P;排数:1;每排PIN数:2;额定电流:3A;触头材质:黄铜;工作温度:-25℃~+85℃;; LCSC Part Name: 1x2P 间距:2.54mm 弯插 系列:XH; Supplier Part: C22751831; Manufacturer: HANBO(汉博); Supplier Footprint: 弯插,P=2.54mm; JLCPCB Part Class: Extended Part; Datasheet: https://item.szlcsc.com/datasheet/WAFER-XH254WZ-2AM/24478766.html; Supplier: LCSC; Pins Structure: 1x2P; Pitch: 2.54mm; Mounting Type: 弯插; Reference Series: XH; Number of Pins: 2P; Number of Rows: 1; Number of PINs Per Row: 2; Current Rating: 3A; Contact Material: 黄铜; Operating Temperature: -25℃~+85℃; Voltage Rating: 250V; Plastic Material: PA66; Flame Retardant Rating: UL94V-0
U3 = AMS1117-3.3_C347222: 输出极性:正极;工作电压:12V;输出电压:3.3V;输出电流:1A;电源纹波抑制比(PSRR):60dB@(120Hz);输出类型:固定;; LCSC Part Name: 3.3V 1A 12V; Supplier Part: C347222; Manufacturer: UMW(友台半导体); Supplier Footprint: SOT-223; JLCPCB Part Class: Extended Part; Datasheet: https://item.szlcsc.com/datasheet/AMS1117-3.3/323882.html; Supplier: LCSC; Output Configuration: 正极; Voltage - Supply: 12V; Output Voltage: 3.3V; Output Current: 1A; Power Supply Rejection Ratio (PSRR): 60dB@(120Hz); Voltage Dropout: 1.3V@(1A); standby current: 5mA; Noise: 0.003%Vout; Features: 过流保护; Operating Temperature: -40℃~+125℃; Output Type: 固定; Number of Outputs: 1

## Nets
+3V3: C2.1 C4.2 C6.2 C8.2 C12.2 C13.2 C14.2 C15.2 C16.2 CN2.2 H2.1 H5.1 H5.3 H6.1 H6.2 HDR1.1 HDR2.20 P1.1 P3.1 P4.1 Q3.2(E) R5.1 R6.1 R10.2 R16.2 R17.1 R21.2 R22.2 R33.2 R34.2 R35.2 R36.2 TFT1.2(VCC) U3.2(VOUT(TAB)) U3.4(TAB) U4.13(VDDA) U4.19(VDD_4) U4.32(VDD_1) U4.48(VDD_2) U4.64(VDD_3) U5.1(A) U7.1 U8.1 U9.4(V3) U9.16(VCC) VR1.1
+5V: BUZZER1.1(+) C1.1 C3.2 C5.1 D2.1(K) U1.2(VO-) U2.2(VO-) U3.3(VIN) U6.2(VO-)
GND: BT2.2 C1.2 C2.2 C3.1 C4.1 C5.2 C6.1 C7.1 C8.1 C12.1 C13.1 C14.1 C15.1 C16.1 C17.2 C18.1 C19.2 C21.2 C22.1 CN1.2 CN2.1 CN2.5 CN2.6 H2.4 H5.2 H5.4 H6.5 H6.6 HDR2.19 LED4.1(-) LED5.1(-) LED6.1(-) P1.4 P1.5 P1.6 P3.4 P3.5 P3.6 P4.4 P4.5 P4.6 Q1.2(E) R1.2 R2.2 R4.2 R8.2 R9.1 R11.2 R12.2 SW1.3 SW1.4 SW2.1 SW3.3 SW3.4 TFT1.1(GND) U1.1(GND) U2.1(GND) U3.1(ADJ(GND)) U4.12(VSSA) U4.18(VSS_4) U4.31(VSS_1) U4.47(VSS_2) U4.63(VSS_3) U6.1(GND) U7.6 U7.7 U7.8 U8.6 U8.7 U8.8 U9.1(GND) USB1.13(EH) USB1.14(EH) USB1.A1B12(GND) USB1.B1A12(GND) USB2.13(EH) USB2.14(EH) USB2.A1B12(GND) USB2.B1A12(GND) VR1.3 X3.2(GND) X3.4(GND)
VBAT: C17.1 U4.1(VBAT) U5.3(K)
VBUS1: U1.3(VI+) USB1.A4B9(VBUS) USB1.B4A9(VBUS)
VBUS2: U6.3(VI+) USB2.A4B9(VBUS) USB2.B4A9(VBUS)
VBUS3: CN1.1 U2.3(VI+)
ADC_EXT0: HDR2.2 U4.8(PC0)
ADC_EXT1: HDR2.3 U4.9(PC1)
ADC_EXT2: HDR2.4 U4.10(PC2)
ADC_EXT3: HDR2.5 U4.11(PC3)
ADC_EXT4: HDR2.7 U4.15(PA1)
ADC_POT: HDR2.6 U4.14(PA0-WKUP) VR1.2
AUX_PA15: HDR1.12 U4.50(PA15)
AUX_PB0: HDR2.14 TFT1.5(RES) U4.26(PB0)
AUX_PB1: HDR2.15 U4.27(PB1)
AUX_PB3: HDR1.17 U4.55(PB3)
AUX_PB4: HDR1.18 U4.56(PB4)
BOOT0: R8.1 R13.1 R15.1 U4.60(BOOT0)
BOOT1: R9.2 R14.2 U4.28(PB2)
BUZZ_PWM: HDR1.9 R3.1 U4.41(PA8)
DTR: R7.1 U9.13(DTR#)
GPIO_PB8: TFT1.7(CS) U4.61(PB8)
GPIO_PB9: TFT1.6(DC) U4.62(PB9)
I2C1_SCL: CN2.3 HDR1.20 R6.2 U4.58(PB6)
I2C1_SDA: CN2.4 R5.2 U4.59(PB7)
KEY1: SW1.1 SW1.2 U4.24(PC4)
KEY2: SW3.1 SW3.2 U4.25(PC5)
LED2: HDR1.19 R19.1 U4.57(PB5)
NRST: C18.2 D1.2(A) HDR2.1 R10.1 SW2.2 U4.7(NRST)
OSC32_IN: C21.1 U4.3(PC14-OSC32_IN) X4.1(OSC1)
OSC32_OUT: C22.2 U4.4(PC15-OSC32_OUT) X4.2(OSC2)
OSC_IN: C19.1 U4.5(PD0-OSC_IN) X3.1
OSC_OUT: C7.2 U4.6(PD1-OSC_OUT) X3.3
PA2: HDR2.8 P1.2 R21.1 U4.16(PA2)
PA3: HDR2.9 P1.3 R22.1 U4.17(PA3)
PA4: HDR2.10 U4.20(PA4) U7.2
PA5: HDR2.11 TFT1.3(SCK) U4.21(PA5) U7.3
PA6: HDR2.12 U4.22(PA6) U7.4
PA7: HDR2.13 TFT1.4(SDA) U4.23(PA7) U7.5
PA9: HDR1.10 U4.42(PA9) U9.3(RXD)
PA10: HDR1.11 U4.43(PA10) U9.2(TXD)
PA11: U4.44(PA11) USB1.A7(Dn1) USB1.B7(Dn2)
PA12: U4.45(PA12) USB1.A6(Dp1) USB1.B6(Dp2)
PA13: H2.2 U4.46(PA13)
PA14: H2.3 U4.49(PA14)
PB10: HDR2.16 P3.2 R33.1 U4.29(PB10)
PB11: HDR2.17 P3.3 R34.1 U4.30(PB11)
PB12: HDR2.18 U4.33(PB12) U8.2
PB13: HDR1.2 U4.34(PB13) U8.3
PB14: HDR1.3 U4.35(PB14) U8.4
PB15: HDR1.4 U4.36(PB15) U8.5
PC6: HDR1.5 TFT1.8(BL) U4.37(PC6)
PC7: HDR1.6 U4.38(PC7)
PC8: HDR1.7 U4.39(PC8)
PC9: HDR1.8 U4.40(PC9)
PC10: HDR1.13 P4.2 R35.1 U4.51(PC10)
PC11: HDR1.14 P4.3 R36.1 U4.52(PC11)
PC12: HDR1.15 U4.53(PC12)
PC13: R18.1 U4.2(PC13-TAMPER-RTC)
PD2: HDR1.16 U4.54(PD2)
RTS: Q2.2(E) Q3.1(B) U9.14(RTS#)
USB_D+: U9.5(D+) USB2.A6(Dp1) USB2.B6(Dp2)
USB_D-: U9.6(D-) USB2.A7(Dn1) USB2.B7(Dn2)
$1N664: BT2.1 U5.2(A)
$1N720: R11.1 USB2.B5(CC2)
$1N724: R12.1 USB2.A5(CC1)
$1N745: LED5.2(+) R18.2
$1N748: LED6.2(+) R19.2
$1N755: H6.3 R13.2
$1N756: H6.4 R14.1
$1N759: LED4.2(+) R17.2
$2N8: R2.1 USB1.A5(CC1)
$2N11: R1.1 USB1.B5(CC2)
$3N13: Q1.1(B) R3.2 R4.1
$3N14: BUZZER1.2(-) D2.2(A) Q1.3(C)
$3N51: Q2.1(B) R7.2
$3N54: Q3.3(C) R15.2
$3N55: D1.1(K) Q2.3(C) R16.1

Not connected (* = marked no-connect by the designer): BUZZER1 3(NC)*; SCREW1 1*; SCREW2 1*; SCREW3 1*; SCREW4 1*; U9 7(NC.)* 8(OUT#)* 9(CTS#)* 10(DSR#)* 11(RI#)* 12(DCD#)* 15(R232)*; USB1 A8(SBU1)* B8(SBU2)*; USB2 A8(SBU1)* B8(SBU2)*

## Notes on the sheets
sheet 1
- 排针
- 电源接口
- 复位电路
- 主控
- UART-TYPE-C接口
- 晶振电路
- LED指示灯
- 启动模式选择电路
sheet 2
- USB-TYPE-C接口
- +5V接口
- LDO电路
sheet 3
- 下载电路接口
- 按键电路
- 蜂鸣器电路
- IIC
- SPI
- 电位器
- SPI显示屏
- 上拉电阻在需要作为IIC接口使用时焊接，作为串口时不焊接
- 自动下载电路
